# Altium project Battery bank.PrjPcb (part 2 of 2)

## Sheet Controller_Sheet.SchDoc
size 420 x 297 mm; SheetNumber: 2; SheetTotal: 2
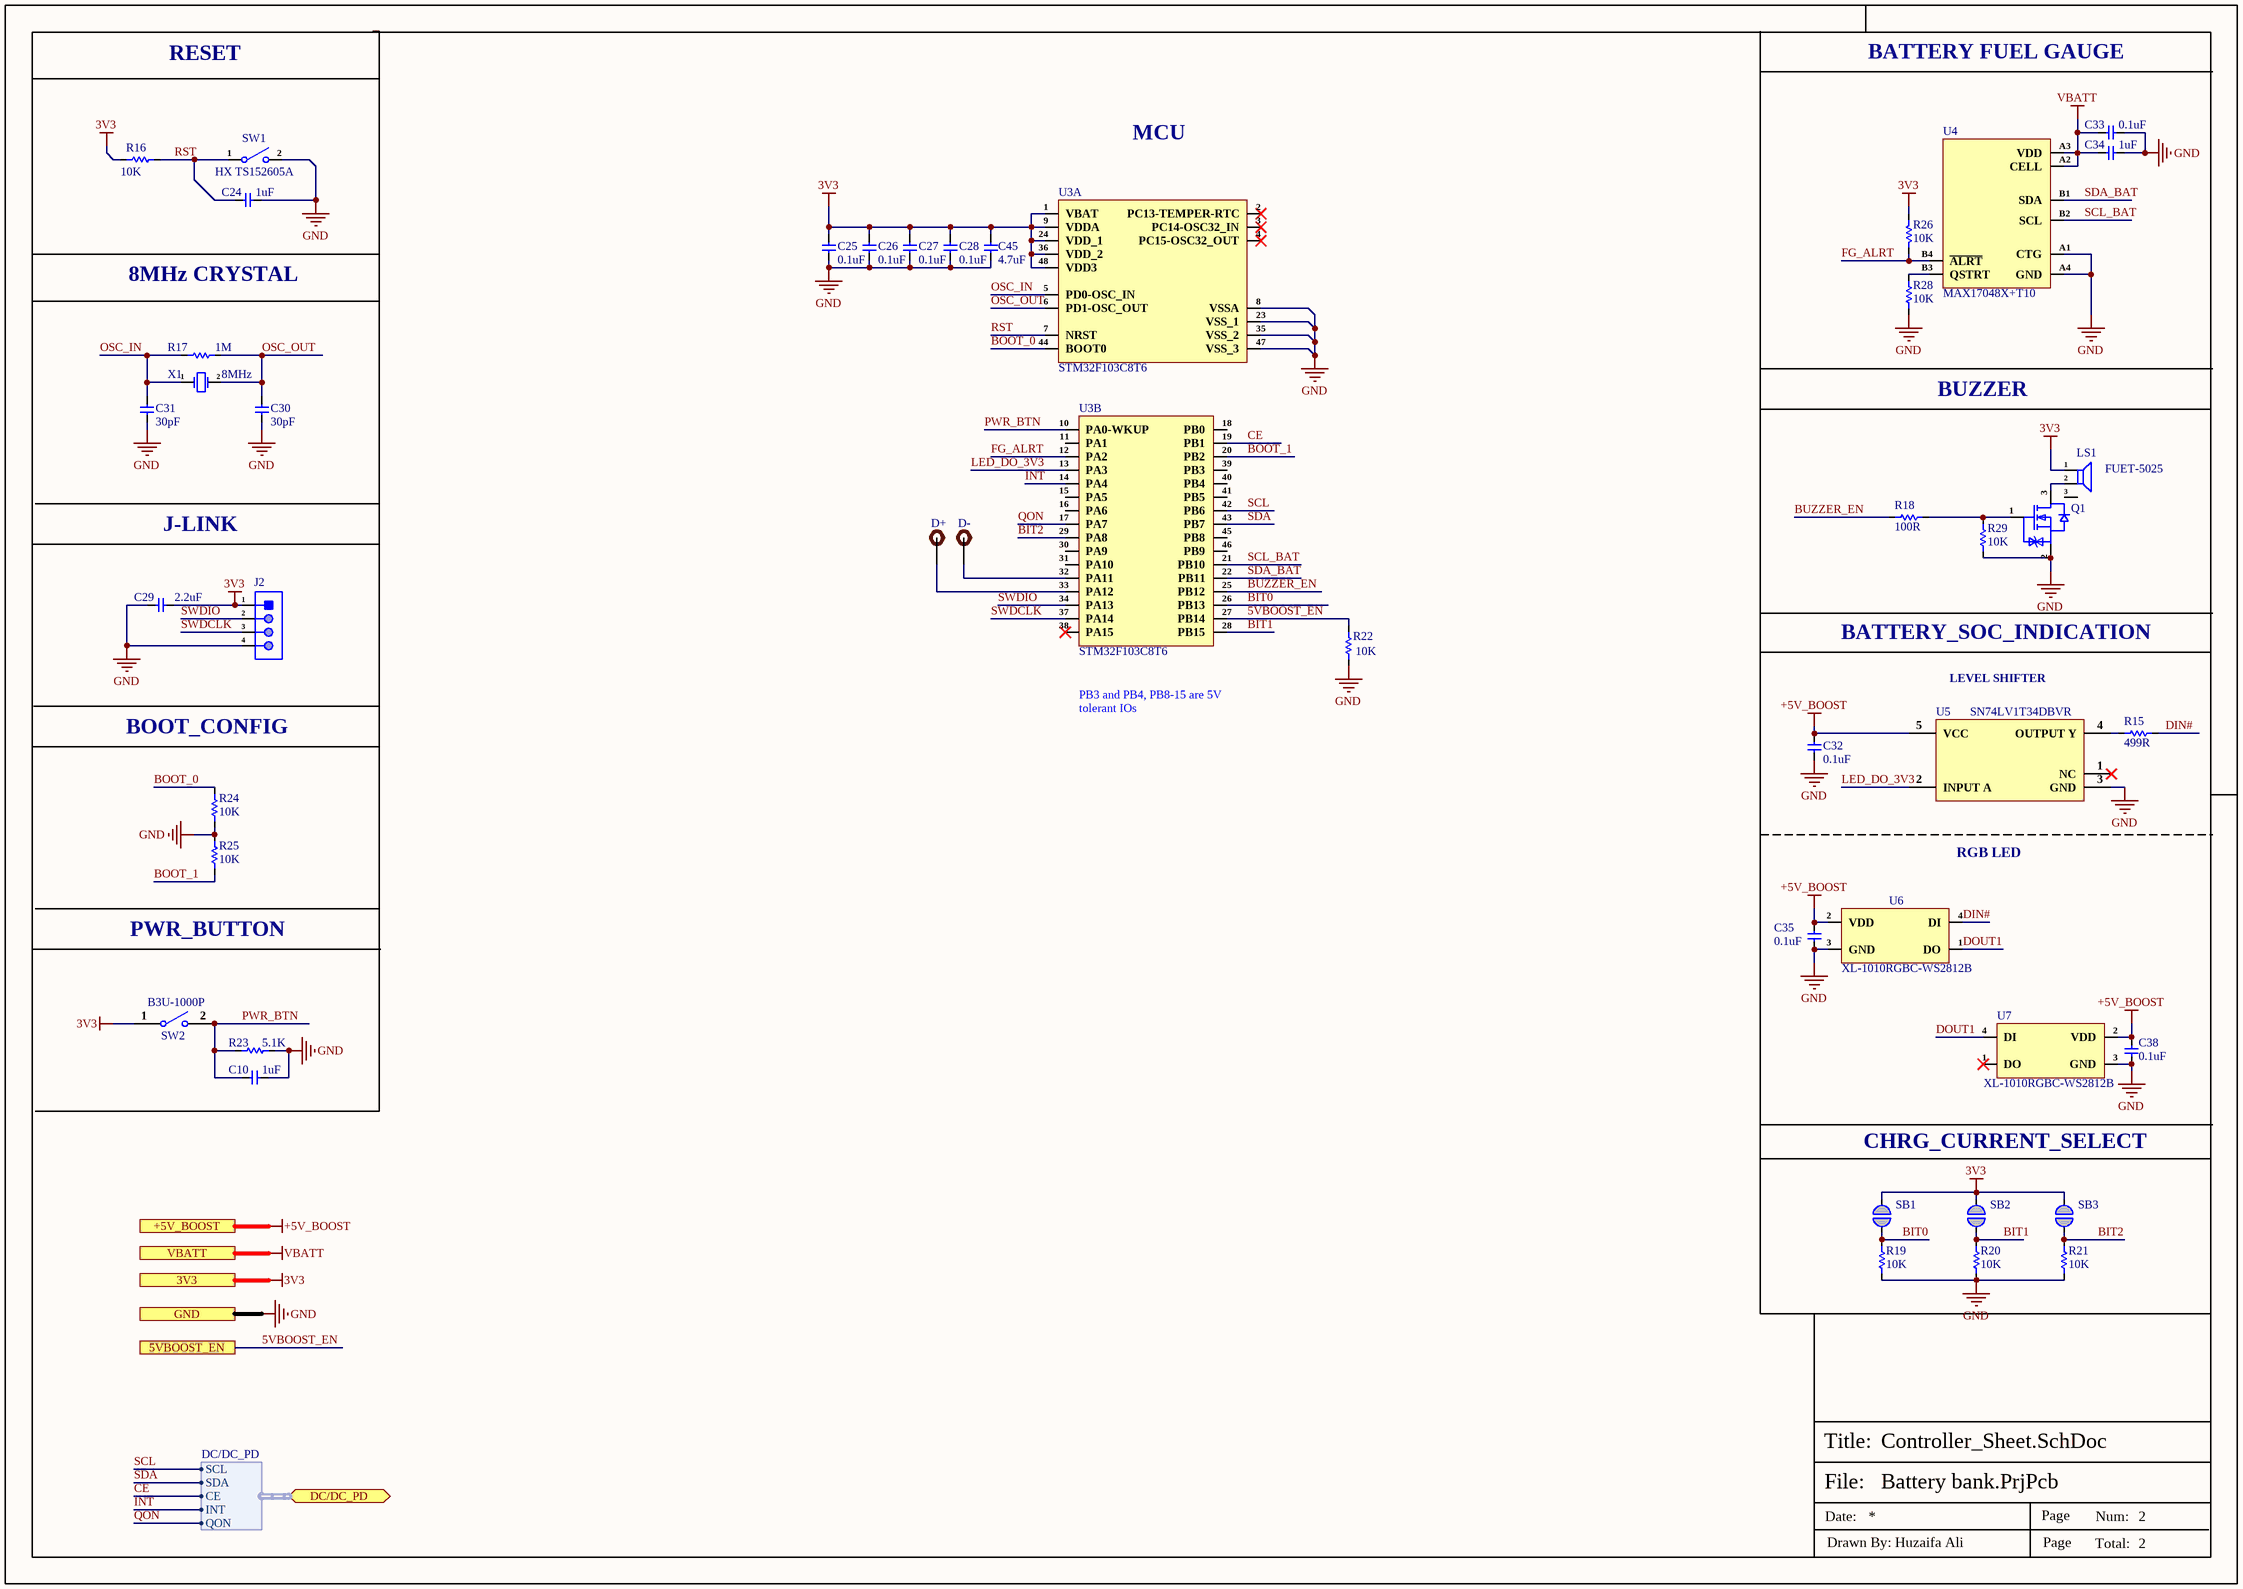
[diagram p1: Controller_Sheet.SchDoc]

### Parts
C10  1uF  [CAP-0201]
C24  1uF  [CAP-0201]
C25  0.1uF  [CAP-0201]
C26  0.1uF  [CAP-0201]
C27  0.1uF  [CAP-0201]
C28  0.1uF  [CAP-0201]
C29  2.2uF  [CAP-0201]
C30  30pF  [Cap-0201]
C31  30pF  [Cap-0201]
C32  0.1uF  [CAP-0201]
C33  0.1uF  [CAP-0201]
C34  1uF  [CAP-0201]
C35  0.1uF  [CAP-0201]
C38  0.1uF  [CAP-0201]
C45  4.7uF  [Cap-0402]
D+  TEST POINT 0.5mm Dia  [Test-point - 0.5mm]  (value not drawn)  (no BOM)
D-  TEST POINT 0.5mm Dia  [Test-point - 0.5mm]  (value not drawn)  (no BOM)
J2  ZX-PZ1.27-1-4PZZ  [ZX-PZ1.27-1-4PZZ]  (value not drawn)
LS1  FUET-5025  [FUET-5025]
Q1  RV2C010UNT2L  [DFN1006-3]  (value not drawn)
R15  499R  [Res-0201]
R16  10K  [Res-0201]
R17  1M  [Res-0201]
R18  100R  [Res-0201]
R19  10K  [Res-0201]
R20  10K  [Res-0201]
R21  10K  [Res-0201]
R22  10K  [Res-0201]
R23  5.1K  [Res-0201]
R24  10K  [Res-0201]
R25  10K  [Res-0201]
R26  10K  [Res-0201]
R28  10K  [Res-0201]
R29  10K  [Res-0201]
SB1  Solder Bridge 0603  [Solder Bridge]  (value not drawn)  (no BOM)
SB2  Solder Bridge 0603  [Solder Bridge]  (value not drawn)  (no BOM)
SB3  Solder Bridge 0603  [Solder Bridge]  (value not drawn)  (no BOM)
SW1  HX TS152605A  [HX TS152605A 160gf]
SW2  B3U-1000P  [B3U-1000P]
U3  STM32F103C8T6  [48-LQFP (7x7)_]  (parts A,B of 2)
U4  MAX17048X+T10  [8-WLP (1.66x0.92)]
U5  SN74LV1T34DBVR  [SOT-23-5]
U6  XL-1010RGBC-WS2812B  [XL-1010RGBC-WS2812B]
U7  XL-1010RGBC-WS2812B  [XL-1010RGBC-WS2812B]
X1  8MHz  [0153G2-8.000F20DTNJL]

### Ports
3V3, 5VBOOST_EN, +5V_BOOST, DC/DC_PD (bidir, harness DC/DC_PD), GND, VBATT

### Harnesses
DC/DC_PD: SCL, SDA, CE, INT, QON

### Nets
3V3: C25.2 C26.2 C27.2 C28.2 C29.1 C45.2 J2.1 LS1.1(+) R16.2 R26.2 SB1.1 SB2.1 SB3.1 SW2.1 U3.1(VBAT) U3.9(VDDA) U3.24(VDD_1) U3.36(VDD_2) U3.48(VDD3) ; port 3V3
+5V_BOOST: C32.2 C35.2 C38.2 U5.5(VCC) U6.2(VDD) U7.2(VDD) ; port +5V_BOOST
GND: C10.2 C24.2 C25.1 C26.1 C27.1 C28.1 C29.2 C30.1 C31.1 C32.1 C33.2 C34.2 C35.1 C38.1 C45.1 J2.4 Q1.2(S) R19.1 R20.1 R21.1 R22.1 R23.2 R24.2 R25.1 R28.1 R29.1 SW1.2 U3.8(VSSA) U3.23(VSS_1) U3.35(VSS_2) U3.47(VSS_3) U4.A1(CTG) U4.A4(GND) U5.3(GND) U6.3(GND) U7.3(GND) ; port GND
VBATT: C33.1 C34.1 U4.A2(CELL) U4.A3(VDD) ; port VBATT
5VBOOST_EN: R22.2 U3.27(PB14) ; port 5VBOOST_EN
BIT0: R19.2 SB1.2 U3.26(PB13)
BIT1: R20.2 SB2.2 U3.28(PB15)
BIT2: R21.2 SB3.2 U3.29(PA8)
BOOT_0: R24.1 U3.44(BOOT0)
BOOT_1: R25.2 U3.20(PB2)
BUZZER_EN: R18.1 U3.25(PB12)
CE: U3.19(PB1) ; port DC/DC_PD.CE
DIN#: R15.2 U6.4(DI)
DOUT1: U6.1(DO) U7.4(DI)
FG_ALRT: R26.1 U3.12(PA2) U4.B4(~{ALRT})
INT: U3.14(PA4) ; port DC/DC_PD.INT
LED_DO_3V3: U3.13(PA3) U5.2(INPUT_A)
OSC_IN: C31.2 R17.1 U3.5(PD0-OSC_IN) X1.1(OSC1)
OSC_OUT: C30.2 R17.2 U3.6(PD1-OSC_OUT) X1.2(OSC2)
PWR_BTN: C10.1 R23.1 SW2.2 U3.10(PA0-WKUP)
QON: U3.17(PA7) ; port DC/DC_PD.QON
RST: C24.1 R16.1 SW1.1 U3.7(NRST)
SCL: U3.42(PB6) ; port DC/DC_PD.SCL
SCL_BAT: U3.21(PB10) U4.B2(SCL)
SDA: U3.43(PB7) ; port DC/DC_PD.SDA
SDA_BAT: U3.22(PB11) U4.B1(SDA)
SWDCLK: J2.3 U3.37(PA14)
SWDIO: J2.2 U3.34(PA13)
NetD+_1: D+.1 U3.33(PA12)
NetD-_1: D-.1 U3.32(PA11)
NetLS1_2: LS1.2(-) Q1.3(D)
NetQ1_1: Q1.1(G) R18.2 R29.2
NetR15_1: R15.1 U5.4(OUTPUT_Y)
NetR28_2: R28.2 U4.B3(QSTRT)

Not connected (* = marked no-connect by the designer): LS1 3; U3 2(PC13-TEMPER-RTC)* 3(PC14-OSC32_IN)* 4(PC15-OSC32_OUT)* 11(PA1) 15(PA5) 16(PA6) 18(PB0) 30(PA9) 31(PA10) 38(PA15)* 39(PB3) 40(PB4) 41(PB5) 45(PB8) 46(PB9); U5 1(NC)*; U7 1(DO)*

### Notes on the sheet
- BATTERY FUEL GAUGE
- RESET
- MCU
- 8MHz CRYSTAL
- BUZZER
- J-LINK
- BATTERY_SOC_INDICATION
- BOOT_CONFIG
- PB3 and PB4, PB8-15 are 5V tolerant IOs
- (near U5) LEVEL SHIFTER
- RGB LED
- (near R25) PWR_BUTTON
- CHRG_CURRENT_SELECT
- File:
- Title:
- Date:
- Page
- Num:
- Total:
- Drawn By: Huzaifa Ali

### Library data of the parts
C10 C24 C34 = GRM033R61C105ME15D: CAP CER 1UF 16V X5R 0201; Manufacturer: Murata; Item Type: Capacitor; Supplier 1: Digi-Key; Manufacturer Part Number: GRM033R61C105ME15D; RoHS: No; Category: Ceramic Capacitors; Stock 1: 12823; Pricing 1: 1=0.14, 10=0.098, 50=0.0554, 100=0.0459, 500=0.0322, 1000=0.02665, 2500=0.02481, 5000=0.0227 (USD); ComponentLink1URL: https://datasheet.octopart.com/GRM033R61C105ME15D-Murata-datasheet-155345049.pdf?src-supplier=Element14; ComponentLink1Description: https://datasheet.octopart.com/GRM033R61C105ME15D-Murata-datasheet-155345049.pdf?src-supplier=Element14; ComponentLink2URL: https://datasheet.octopart.com/GRM033R61C105ME15D-Murata-datasheet-165579666.pdf?src-supplier=TME; ComponentLink2Description: https://datasheet.octopart.com/GRM033R61C105ME15D-Murata-datasheet-165579666.pdf?src-supplier=TME; LCSC Part Number: C335102; Supplier Part Number 1: 490-18654-1-ND
C25-C28 C32 C33 C35 C38 = GRM033C81E104KE14D: CAP CER 0.1UF 25V X6S 0201; Manufacturer: Murata; Capacitance: 100nF; Tolerance: 10%; Supplier 1: Digi-Key; Manufacturer Part Number: GRM033C81E104KE14D; RoHS: Yes; Category: Ceramic Capacitors; Stock 1: 91; Pricing 1: 1=0.10000, 10=0.05100, 50=0.02780, 100=0.02260, 500=0.01616, 1000=0.01270, 2500=0.01155, 5000=0.01063 (USD); Mount: Surface Mount; Case/Package: 0201; Case Code (Metric): 0603; Case Code (Imperial): 0201; Weight: 1.2E-05oz; Min Operating Temperature: -55°C; Max Operating Temperature: 105°C; Packaging: Tape and Reel; Voltage Rating: 25V; Dielectric: X6S; Termination: SMD/SMT; Voltage Rating (DC): 25V; Package Quantity: 15000; Length: 0.024inch; Width: 0.3mm; Height: 0.3mm; Thickness: 0.013inch; RoHS Compliant: Yes; ComponentLink1URL: http://www.mouser.com/ds/2/281/c02e-2905.pdf?src-supplier=Mouser; ComponentLink1Description: http://www.mouser.com/ds/2/281/c02e-2905.pdf?src-supplier=Mouser; ComponentLink2URL: http://www.farnell.com/datasheets/2722733.pdf?src-supplier=Farnell; ComponentLink2Description: http://www.farnell.com/datasheets/2722733.pdf?src-supplier=Farnell; ComponentLink3URL: http://search.murata.co.jp/Ceramy/image/img/A01X/G101/ENG/GRM033C81E104KE14-01.pdf?src-supplier=Digi-Key; ComponentLink3Description: http://search.murata.co.jp/Ceramy/image/img/A01X/G101/ENG/GRM033C81E104KE14-01.pdf?src-supplier=Digi-Key; Supplier Part Number 1: 490-10403-1-ND
C29 = CC0201MRX5R6BB225: CAP CER 2.2UF 10V X5R 0201; Manufacturer: Yageo; Tolerance: 20%; Item Type: Capacitor; Supplier: Mouser; Supplier Part Number: 603-CC0201MRX56BB225; Manufacturer Part Number: CC0201MRX5R6BB225; RoHS: Yes; Category: Ceramic Capacitors; Stock: 25553; Pricing: 1=0.43, 10=0.294, 50=0.294, 100=0.176, 1000=0.112, 10000=0.091 (USD); Mounting Technology: Surface Mount; Case/Package: 0201; Min Operating Temperature: -55°C; Max Operating Temperature: 85°C; Packaging: Tape and Reel; Value: 2.2uF; Voltage Rating: 10V; Series: CC; RoHS Compliant: Yes; ComponentLink1URL: https://www.yageo.com/upload/media/product/productsearch/datasheet/mlcc/UPY-GPHC_X5R_4V-to-50V_26.pdf?src-supplier=Digi-Key; ComponentLink1Description: https://www.yageo.com/upload/media/product/productsearch/datasheet/mlcc/UPY-GPHC_X5R_4V-to-50V_26.pdf?src-supplier=Digi-Key; LCSC Part Number: C2186869
C30 C31 = CC0201FRNPO9BN300: CAP CER 30PF 50V C0G/NPO 0201; Manufacturer: Yageo; Item Type: Capacitors; Supplier: Digikey; LCSC Part Number: C541318; Manufacturer Part Number: CC0201FRNPO9BN300; RoHS: No; Stock: 25330; Pricing: 1=0.1, 10=0.041, 100=0.0239, 1000=0.0152, 2500=0.01306, 5000=0.01178 (USD)
C45 = CL05A475MO5NUNC: CAP CER 4.7UF 16V X5R 0402; Manufacturer: Samsung; Material: 4241ConductorMaterial; Tolerance: 20%; Supplier 1: Avnet; Manufacturer Part Number: CL05A475MO5NUNC; RoHS: Yes; Category: Ceramic Capacitors; Stock 1: 50000; Pricing 1: 10000=0.09712 (USD); Mount: Surface Mount; Case/Package: 0402; Case Code (Metric): 1005; Case Code (Imperial): 0402; Min Operating Temperature: -55°C; Max Operating Temperature: 85°C; Packaging: Cut Tape; Capacitance: 4.7uF; Voltage Rating: 16V; Series: CL; Voltage Rating (DC): 16V; Length: 0.039inch; Width: 0.02inch; Height: 550um; Thickness: 0.022inch; RoHS Compliant: Yes; ComponentLink1URL: http://www.farnell.com/datasheets/2710653.pdf?src-supplier=Farnell; ComponentLink1Description: http://www.farnell.com/datasheets/2710653.pdf?src-supplier=Farnell; ComponentLink2URL: http://www.samsungsem.com/kr/support/product-search/mlcc/CL05A475MO5NUNC.jsp?src-supplier=Digikey; ComponentLink2Description: http://www.samsungsem.com/kr/support/product-search/mlcc/CL05A475MO5NUNC.jsp?src-supplier=Digikey; ComponentLink3URL: http://www.farnell.com/datasheets/2710653.pdf?src-supplier=Element14; ComponentLink3Description: http://www.farnell.com/datasheets/2710653.pdf?src-supplier=Element14; ComponentLink4URL: https://datasheet.octopart.com/CL05A475MO5NUNC-Samsung-Electro-Mechanics-datasheet-123102911.pdf?src-supplier=Future+Electronics; ComponentLink4Description: https://datasheet.octopart.com/CL05A475MO5NUNC-Samsung-Electro-Mechanics-datasheet-123102911.pdf?src-supplier=Future+Electronics; ComponentLink5URL: http://www.farnell.com/datasheets/2710653.pdf?src-supplier=Newark; ComponentLink5Description: http://www.farnell.com/datasheets/2710653.pdf?src-supplier=Newark; Supplier Part Number 1: CL05A475MO5NUNC
D+ D- = TEST POINT 0.5mm Dia: Test Point ON; Item Type: Test Point; Manufacturer Part Number: TEST POINT 0.5mm Dia
J2 = ZX-PZ1.27-1-4PZZ: Gold 1A Straight Policy 1mm 4P 3.9mm -40℃~+105℃ 2.3mm 1.27mm Brass Black Single Row 1x4P Plugin,P=1.27mm Pin Headers ROHS; Manufacturer: Megastar; Item Type: Header; Manufacturer Part Number: ZX-PZ1.27-1-4PZZ; Package: Plugin,P=1.27mm; LCSC Part Number: C41370736; ComponentLink1Description: LCSC; ComponentLink1URL: https://www.lcsc.com/product-detail/Pin-Headers_Megastar-ZX-PZ1-27-1-4PZZ_C41370736.html
LS1 = FUET-5025: 80dB Passive (external drive) Electromagnetic Type 4kHz SMD,5x5mm Buzzers ROHS; Manufacturer: FUET; Manufacturer Part Number: FUET-5025; Package: SMD,5x5mm; LCSC Part Number: C391030; Item Type: Buzzers; ComponentLink1Description: LCSC; ComponentLink1URL: https://www.lcsc.com/product-detail/Buzzers_FUET-FUET-5025_C391030.html
Q1 = RV2C010UNT2L: MOSFET N-CH 20V 1A DFN1006-3; Manufacturer: Rohm; Item Type: MOSFETs; Drain to Source Resistance: 340mR; Supplier: Mouser; LCSC Part Number: C570828; Manufacturer Part Number: RV2C010UNT2L; RoHS: Yes; Stock: 16470; Pricing: 1=0.42, 10=0.261, 50=0.261, 100=0.123, 1000=0.086, 10000=0.073 (USD); ComponentLink1URL: http://www.mouser.com/ds/2/348/rv2c010un-e-1139137.pdf?src-supplier=Mouser; ComponentLink1Description: http://www.mouser.com/ds/2/348/rv2c010un-e-1139137.pdf?src-supplier=Mouser; ComponentLink2URL: http://www.farnell.com/datasheets/1945594.pdf?src-supplier=Farnell; ComponentLink2Description: http://www.farnell.com/datasheets/1945594.pdf?src-supplier=Farnell; ComponentLink3URL: https://www.rohm.com/datasheet/RV2C010UN/rv2c010un-e?src-supplier=Digikey; ComponentLink3Description: https://www.rohm.com/datasheet/RV2C010UN/rv2c010un-e?src-supplier=Digikey; ComponentLink4URL: http://rohmfs.rohm.com/en/techdata_basic/transistor/taping/VML1006_T2L_taping.pdf?src-supplier=Digikey; ComponentLink4Description: http://rohmfs.rohm.com/en/techdata_basic/transistor/taping/VML1006_T2L_taping.pdf?src-supplier=Digikey; ComponentLink5URL: http://rohmfs.rohm.com/en/products/databook/datasheet/discrete/transistor/mosfet/rv2c010unt2l.pdf?src-supplier=Avnet; ComponentLink5Description: http://rohmfs.rohm.com/en/products/databook/datasheet/discrete/transistor/mosfet/rv2c010unt2l.pdf?src-supplier=Avnet; ComponentLink6URL: https://datasheet.octopart.com/RV2C010UNT2L-Rohm-datasheet-57364635.pdf?src-supplier=Element14; ComponentLink6Description: https://datasheet.octopart.com/RV2C010UNT2L-Rohm-datasheet-57364635.pdf?src-supplier=Element14
R15 = RC0201FR-07499RL: RES 499 OHM 1% 1/20W 0201; Manufacturer: Yageo; Max Power Dissipation: 50mW; Temperature Coefficient: 200ppm/°C; Item Type: Resistor; Supplier 1: Avnet; Manufacturer Part Number: RC0201FR-07499RL; RoHS: Yes; Category: Chip SMD Resistors; Stock 1: 150000; Pricing 1: 10000=0.00128 (USD); Case/Package: 0201; Case Code (Metric): 0603; Case Code (Imperial): 0201; Min Operating Temperature: -55°C; Max Operating Temperature: 125°C; Resistance: 499R; Tolerance: 1%; Packaging: Tape and Reel; Resistor Type: Thick Film; Number of Terminations: 2; Features: Moisture Resistant; Length: 0.024inch; Width: 0.012inch; Height: 0.01inch; Depth: 0.3mm; Military Standard: Not; Lead Free: Lead Free; RoHS Compliant: Yes; ComponentLink1URL: http://www.yageo.com/documents/recent/PYu-RC_Group_51_RoHS_L_10.pdf?src-supplier=Digi-Key; ComponentLink1Description: http://www.yageo.com/documents/recent/PYu-RC_Group_51_RoHS_L_10.pdf?src-supplier=Digi-Key; ComponentLink2URL: http://www.yageo.com/documents/recent/PYu-RC_Group_51_RoHS_L_9.pdf?src-supplier=Digi-Key; ComponentLink2Description: http://www.yageo.com/documents/recent/PYu-RC_Group_51_RoHS_L_9.pdf?src-supplier=Digi-Key; Supplier Part Number 1: RC0201FR-07499RL; LCSC Part Number: C138137
R16 R19-R22 R24-R26 R28 R29 = RC0201FR-0710KL: RES SMD 10K OHM 1% 1/20W 0201; Manufacturer: Yageo; Item Type: Resistor; Manufacturer Part Number: RC0201FR-0710KL; Package: 0201; ComponentLink7Description: LCSC; ComponentLink7URL: https://www.lcsc.com/product-detail/Chip-Resistor-Surface-Mount_YAGEO-RC0201FR-0710KL_C106225.html; LCSC Part Number: C106225
R17 = RC0201FR-071ML: RES 1M OHM 1% 1/20W 0201; Manufacturer: Yageo; Item Type: Resistor; Value: 1MR; Temperature Coefficient: 200ppm/°C; Power Rating: 50mW; Voltage Rating: 25V; Supplier: Avnet; LCSC Part Number: C295786; Manufacturer Part Number: RC0201FR-071ML; RoHS: Yes; Stock: 13025; Pricing: 1=0.104, 25=0.016, 100=0.008, 250=0.007, 1000=0.006 (USD); Case/Package: 0201; Contact Plating: Tin,Matte; Case Code (Imperial): 0201; Case Code (Metric): 0603; Min Operating Temperature: -55°C; Max Operating Temperature: 125°C; Tolerance: 1%; Resistor Type: Thick Film; Packaging: Tape and Reel; Package Quantity: 10000; Termination: SMD/SMT; Number of Terminations: 2; Max Power Dissipation: 50mW; Features: Moisture Resistant; Series: RC; Resistance Tolerance: 1%; Construction: Rectangular; Voltage Rating (DC): 25V; Length: 0.6mm; Width: 0.3mm; Height: 0.01inch; Depth: 0.3mm; Military Standard: Not; RoHS Compliant: Yes; Reach SVHC Compliant: Unknown; Lead Free: 5697LeadFree; ComponentLink1URL: https://datasheet.ciiva.com/29721/pyu-r-int-thick-7-29721005.pdf?src-supplier=Digikey; ComponentLink1Description: https://datasheet.ciiva.com/29721/pyu-r-int-thick-7-29721005.pdf?src-supplier=Digikey; ComponentLink2URL: https://datasheet.ciiva.com/29721/pyu-r-int-thick-7-29721006.pdf?src-supplier=Digikey; ComponentLink2Description: https://datasheet.ciiva.com/29721/pyu-r-int-thick-7-29721006.pdf?src-supplier=Digikey; ComponentLink3URL: https://datasheet.ciiva.com/7672/1563626-7672207.pdf?src-supplier=Element14; ComponentLink3Description: https://datasheet.ciiva.com/7672/1563626-7672207.pdf?src-supplier=Element14; ComponentLink4URL: https://datasheet.ciiva.com/22698/1563626-22698507.pdf?src-supplier=Element14; ComponentLink4Description: https://datasheet.ciiva.com/22698/1563626-22698507.pdf?src-supplier=Element14; ComponentLink5URL: https://datasheet.ciiva.com/25647/pyu-r-int-thick-7-25647311.pdf?src-supplier=Digikey; ComponentLink5Description: https://datasheet.ciiva.com/25647/pyu-r-int-thick-7-25647311.pdf?src-supplier=Digikey
R18 = RC0201FR-07100RL: RES 100 OHM Thick Film 0201 1% 1/20W ±200ppm/°C Molded SMD SMD Paper T/R; Manufacturer: Yageo; Power Rating: 50mW; Voltage Rating: 25V; Item Type: Resistor; Supplier: Digi-Key; Supplier Part Number: 311-100MCT-ND; Manufacturer Part Number: RC0201FR-07100RL; RoHS: Yes; Category: Chip SMD Resistors; Stock: 193246; Pricing: 1=0.1, 10=0.027, 50=0.0172, 100=0.0143, 500=0.00988, 1000=0.00854, 5000=0.00629 (USD); Case/Package: 0201; Contact Plating: Tin,Matte; Case Code (Metric): 0603; Package: 0201; Min Operating Temperature: -55°C; Max Operating Temperature: 125°C; Value: 100R; Tolerance: 1%; Resistor Type: Thick Film; Temperature Coefficient: 200ppm/°C; Packaging: Cut Tape; Package Quantity: 1; Number of Terminations: 2; Termination: SMD/SMT; Max Power Dissipation: 50mW; Features: Moisture Resistant; Series: RC; Resistance Tolerance: 1%; Length: 0.024inch; Width: 0.012inch; Height: 0.01inch; Lead Free: Lead Free; RoHS Compliant: Yes; Reach SVHC Compliant: Unknown; ComponentLink1URL: https://datasheet.ciiva.com/2560/pyu-r-int-thick-7-2560866.pdf?src-supplier=Digi-Key; ComponentLink1Description: https://datasheet.ciiva.com/2560/pyu-r-int-thick-7-2560866.pdf?src-supplier=Digi-Key; ComponentLink2URL: https://datasheet.ciiva.com/2560/pyu-r-int-thick-7-2560867.pdf?src-supplier=Digi-Key; ComponentLink2Description: https://datasheet.ciiva.com/2560/pyu-r-int-thick-7-2560867.pdf?src-supplier=Digi-Key; ComponentLink3URL: https://datasheet.ciiva.com/2560/pyu-r-int-thick-7-2560865.pdf?src-supplier=Digi-Key; ComponentLink3Description: https://datasheet.ciiva.com/2560/pyu-r-int-thick-7-2560865.pdf?src-supplier=Digi-Key; ComponentLink4URL: https://datasheet.ciiva.com/8887/pyu-rc0201-51-rohs-l-8-8887865.pdf?src-supplier=Avnet; ComponentLink4Description: https://datasheet.ciiva.com/8887/pyu-rc0201-51-rohs-l-8-8887865.pdf?src-supplier=Avnet; LCSC Part Number: C77623; ComponentLink5Description: LCSC; ComponentLink5URL: https://www.lcsc.com/product-detail/Chip-Resistor-Surface-Mount_YAGEO-RC0201FR-07100RL_C77623.html
R23 = RC0201FR-075K1L: RES 5.1K OHM 1% 1/20W 0201; Manufacturer: Yageo; Power Rating: 50mW; Value: 5.1kR; Voltage Rating: 25V; Temperature Coefficient: 200ppm/°C; Item Type: Resistor; Supplier: Future Electronics; Supplier Part Number: 9072847; Manufacturer Part Number: RC0201FR-075K1L; RoHS: Yes; Category: Chip SMD Resistors; Stock: 280000; Pricing: 10000=0.0014, 40000=0.0013, 200000=0.0013, 400000=0.0012, 1250000=0.0011 (USD); Case/Package: 0201; Case Code (Imperial): 0201; Case Code (Metric): 0603; Min Operating Temperature: -55°C; Max Operating Temperature: 125°C; Packaging: Tape and Reel; Tolerance: 1%; Termination: SMD/SMT; Number of Terminations: 2; Max Power Dissipation: 50mW; Features: Moisture Resistant; Series: RC; Length: 0.6mm; Width: 0.3mm; Height: 0.23mm; Lead Free: Lead Free; RoHS Compliant: Yes; ComponentLink1URL: http://www.mouser.com/ds/2/447/RC0201-559633.pdf?src-supplier=Mouser; ComponentLink1Description: http://www.mouser.com/ds/2/447/RC0201-559633.pdf?src-supplier=Mouser; ComponentLink2URL: https://datasheet.octopart.com/RC0201FR-075K1L-Yageo-datasheet-164759695.pdf?src-supplier=Future+Electronics; ComponentLink2Description: https://datasheet.octopart.com/RC0201FR-075K1L-Yageo-datasheet-164759695.pdf?src-supplier=Future+Electronics; ComponentLink3URL: http://www.yageo.com/documents/recent/PYu-RC_Group_51_RoHS_L_10.pdf?src-supplier=Digi-Key; ComponentLink3Description: http://www.yageo.com/documents/recent/PYu-RC_Group_51_RoHS_L_10.pdf?src-supplier=Digi-Key; LCSC Part Number: C274341
SB1-SB3 = Solder Bridge 0603: Solder Bridge ON; Manufacturer Part Number: Solder Bridge; Item Type: Solder Bridge
SW1 = HX TS152605A 160gf: No Without bracket 50mA 2.5mm 200,000 Times 1.6N 12V 1.6mm 0.55mm Vertical welding SPST SMD-4P,2.5x1.6mm Tactile Switches ROHS; Manufacturer: hanxia; Item Type: Switch; Manufacturer Part Number: HX TS152605A 160gf; Package: SMD-4P,2.5x1.6mm; LCSC Part Number: C25168822; ComponentLink1Description: LCSC; ComponentLink1URL: https://lcsc.com/product-detail/Tactile-Switches_hanxia-HX-TS152605A-160gf_C25168822.html
SW2 = B3U-1000P: SWITCH TACTILE SPST-NO 0.05A 12V; Manufacturer: Omron; Mechanical Life: 200000Cycles; Operating Force: 1.5N; Throw Configuration: SPST; Current Rating: 50mA; Contact Resistance: 100mR; Illumination Type: Non-Illuminated,Illuminated; Switch Travel: 0.15mm; Switch Function: Off-Mom; Actuator Type: Standard; Actuator Length: 0.4mm; Ratings: Dust Proof,IP40; ComponentLink1URL: http://www.farnell.com/datasheets/60838.pdf?src-supplier=Farnell; ComponentLink1Description: http://www.farnell.com/datasheets/60838.pdf?src-supplier=Farnell; ComponentLink2URL: http://www.farnell.com/datasheets/60838.pdf?src-supplier=Element14; ComponentLink2Description: http://www.farnell.com/datasheets/60838.pdf?src-supplier=Element14; ComponentLink3URL: https://omronfs.omron.com/en_US/ecb/products/pdf/en-b3u.pdf?src-supplier=Digi-Key; ComponentLink3Description: https://omronfs.omron.com/en_US/ecb/products/pdf/en-b3u.pdf?src-supplier=Digi-Key; ComponentLink4URL: http://www.omron.com/ecb/products/pdf/en-b3u.pdf?src-supplier=Digi-Key; ComponentLink4Description: http://www.omron.com/ecb/products/pdf/en-b3u.pdf?src-supplier=Digi-Key; ComponentLink5URL: https://www.distrelec.biz/Web/Downloads/he/et/B3U_eng_datasheet.pdf?mime=application%2Fpdf&src-supplier=Distrelec; ComponentLink5Description: https://www.distrelec.biz/Web/Downloads/he/et/B3U_eng_datasheet.pdf?mime=application%2Fpdf&src-supplier=Distrelec; ComponentLink6URL: http://www.onlinecomponents.com/productFiles/mf-OM/en-b3u.pdf?src-supplier=Onlinecomponents.com; ComponentLink6Description: http://www.onlinecomponents.com/productFiles/mf-OM/en-b3u.pdf?src-supplier=Onlinecomponents.com; Supplier 1: Digi-Key; Manufacturer Part Number: B3U-1000P; Stock 1: 116454; Pricing 1: 1=1, 10=0.961, 25=0.9064, 50=0.7976, 100=0.7251, 250=0.68888, 500=0.67074, 1000=0.52571 (USD); Mount: Surface Mount; Weight: 0.000776oz; Contact Material: Silver; Min Operating Temperature: -25°C; Max Operating Temperature: 70°C; Packaging: Tape and Reel; Voltage Rating (DC): 12V; Package Quantity: 1; Max Current Rating: 50mA; Termination: SMD/SMT; Orientation: Straight; Max Voltage Rating (DC): 12V; Electrical Life: 200000Cycles; Insulation Resistance: 100MR; Contact Current Rating: 50mA; Length: 4mm; Height: 1.2mm; Depth: 2.5mm; Width: 3mm; REACH SVHC: Unknown; Lead Free: Lead Free; ComponentLink7URL: https://www.verical.com/server-webapp/html/getDatasheet?partID=552554&src-supplier=Verical; ComponentLink7Description: https://www.verical.com/server-webapp/html/getDatasheet?partID=552554&src-supplier=Verical; ComponentLink8URL: http://www.farnell.com/datasheets/1685550.pdf?src-supplier=Element14; ComponentLink8Description: http://www.farnell.com/datasheets/1685550.pdf?src-supplier=Element14; ComponentLink9URL: http://www.farnell.com/datasheets/2610940.pdf?src-supplier=Farnell; ComponentLink9Description: http://www.farnell.com/datasheets/2610940.pdf?src-supplier=Farnell; ComponentLink10URL: https://www.alliedelec.com/m/d/4c8a9ef82804fc3c241a13c1e298fd73.pdf?src-supplier=Allied+Electronics; ComponentLink10Description: https://www.alliedelec.com/m/d/4c8a9ef82804fc3c241a13c1e298fd73.pdf?src-supplier=Allied+Electronics; Supplier Part Number 1: SW1020DKR-ND; LCSC Part Number: C231329; Item Type: Switch
U3 = STM32F103C8T6: ARM Cortex-M3 STM32 F1 Microcontroller 32-Bit 72MHz 64kB FLASH LQFP48 STM32F103C8T6; Manufacturer: STMicroelectronics; RAM Size: 20KB; Interface: I2C,SPI,USB,CAN,USART; Number of I/Os: 37; Number of Timers/Counters: 3; Max Supply Voltage: 3.6V; Number of ADC Channels: 10; Min Supply Voltage: 2V; Data Bus Width: 32b; Nominal Supply Current: 1.7uA; Number of A/D Converters: 2NUMBER; Number of Channels: 10NUMBER; Supplier: Mouser; Supplier Part Number: 511-STM32F103C8T6; Manufacturer Part Number: STM32F103C8T6; RoHS: Yes; Category: Microcontrollers; Stock: 27404; Pricing: 1=6.11, 10=5.53, 50=5.27, 100=4.58, 1000=3.47, 10000=3.33 (USD); Case/Package: LQFP; Pins: 48; Weight: 0.006349oz; Min Operating Temperature: -40°C; Max Operating Temperature: 85°C; Packaging: Tray; Package Quantity: 1500; Memory Format: FLASH; Clock Frequency: 72MHz; Memory Size: 64KB; Core Architecture: ARM; Series: STM32F103C8; Length: 7mm; Width: 7mm; Height: 1.4mm; Lead Free: Lead Free; RoHS Compliant: Yes; ComponentLink1URL: https://datasheet.ciiva.com/8054/1730126-8054942.pdf?src-supplier=Element14; ComponentLink1Description: https://datasheet.ciiva.com/8054/1730126-8054942.pdf?src-supplier=Element14; ComponentLink2URL: https://datasheet.ciiva.com/48687/001075658-da-01-en-mcu-64kb-mem-stm32f103c8t6-lqfp-48-stm-48687589.pdf?src-supplier=Conrad; ComponentLink2Description: https://datasheet.ciiva.com/48687/001075658-da-01-en-mcu-64kb-mem-stm32f103c8t6-lqfp-48-stm-48687589.pdf?src-supplier=Conrad
U4 = MAX17048X+T10: IC BATT MON LI-ION 1CELL 8WLP; Manufacturer: Analog Devices Inc./Maxim Integrated; Manufacturer Part Number: MAX17048X+T10; Package: 8-WLP (1.66x0.92); LCSC Part Number: -; Item Type: IC; ComponentLink1Description: Digikey; ComponentLink1URL: https://www.digikey.com.au/en/products/detail/analog-devices-inc-maxim-integrated/MAX17048X-T10/3758922
U5 = SN74LV1T34DBVR: IC BUF NON-INVERT 5.5V SOT23-5; Manufacturer: Texas Instruments; Number of Elements: 1; Logic Function: Buffer,Inverting; High Level Output Current: -8mA; Low Level Output Current: 8mA; Min Supply Voltage: 1.6V; Polarity: Non-Inverting; Propagation Delay: 15.5ns; Quiescent Current: 1uA; Supplier 1: Digi-Key; Manufacturer Part Number: SN74LV1T34DBVR; Stock 1: 37360; Pricing 1: 1=0.43, 10=0.349, 25=0.3192, 100=0.2374, 250=0.2152, 500=0.17808, 1000=0.13356 (USD); Mount: Surface Mount; Case/Package: SOT-23-5; Number of Pins: 5; Weight: 0.000353oz; Min Operating Temperature: -40°C; Max Operating Temperature: 125°C; Packaging: Tape and Reel; Number of Bits per Element: 1; Number of Bits: 1; Package Quantity: 3000; Max Supply Voltage: 5.5V; Number of Input Lines: 1; Number of Output Lines: 1; Operating Supply Current: 8mA; Number of Channels: 1; Number of Inputs: 1; Number of Outputs: 1; Radiation Hardening: No; RoHS Compliant: Yes; REACH SVHC: No SVHC; Lead Free: Lead Free; ComponentLink1URL: http://www.ti.com/lit/pdf/sdyu001?src-supplier=Digi-Key; ComponentLink1Description: http://www.ti.com/lit/pdf/sdyu001?src-supplier=Digi-Key; ComponentLink2URL: http://www.ti.com/lit/ds/symlink/sn74lv1t34.pdf?src-supplier=Avnet; ComponentLink2Description: http://www.ti.com/lit/ds/symlink/sn74lv1t34.pdf?src-supplier=Avnet; Supplier Part Number 1: 296-37176-6-ND; LCSC Part Number: C100024; Item Type: IC
U6 U7 = XL-1010RGBC-WS2812B: Colorless transparence -40℃~+150℃ 正贴 RGB 120° 1010 Light Emitting Diodes (LED) ROHS; Manufacturer: XINGLIGHT; Item Type: RGB LED; LCSC Part Number: C5349953; Manufacturer Part Number: XL-1010RGBC-WS2812B; Package: 1010; ComponentLink1Description: LCSC; ComponentLink1URL: https://www.lcsc.com/product-detail/span-style-background-color-ff0-RGB-span-LEDs-Built-in-IC_XINGLIGHT-XL-1010RGBC-WS2812B_C5349953.html
X1 = 0153G2-8.000F20DTNJL: 8MHz Surface Mount Crystal 20pF ±10ppm ±30ppm SMD5032 Crystals ROHS; Manufacturer: HCI; Manufacturer Part Number: 0153G2-8.000F20DTNJL; Package: SMD5032; LCSC Part Number: C19270155; Item Type: Crystal; ComponentLink1Description: LCSC; ComponentLink1URL: https://www.lcsc.com/product-detail/Crystals_HCI-0153G2-8-000F20DTNJL_C19270155.html

## Nets that join several sheets
3V3: power_Sheet (9 pins), Controller_Sheet (19 pins)
+5V_BOOST: power_Sheet (C39.2 C40.1 U8.2 U8.4), Controller_Sheet (6 pins)
GND: power_Sheet (38 pins), Controller_Sheet (36 pins)
VBATT: power_Sheet (17 pins), Controller_Sheet (C33.1 C34.1 U4.A2 U4.A3)
5VBOOST_EN: power_Sheet (U8.6), Controller_Sheet (R22.2 U3.27)
CE: power_Sheet (R4.2 U1.13), Controller_Sheet (U3.19)
INT: power_Sheet (R5.2 U1.21), Controller_Sheet (U3.14)
QON: power_Sheet (U1.12), Controller_Sheet (U3.17)
SCL: power_Sheet (R2.1 U1.14), Controller_Sheet (U3.42)
SDA: power_Sheet (R3.1 U1.15), Controller_Sheet (U3.43)